# Altium schematic sheet HSS 2026 Blok Diyagram.SchDoc
size A2; SheetNumber: 1; SheetTotal: 7
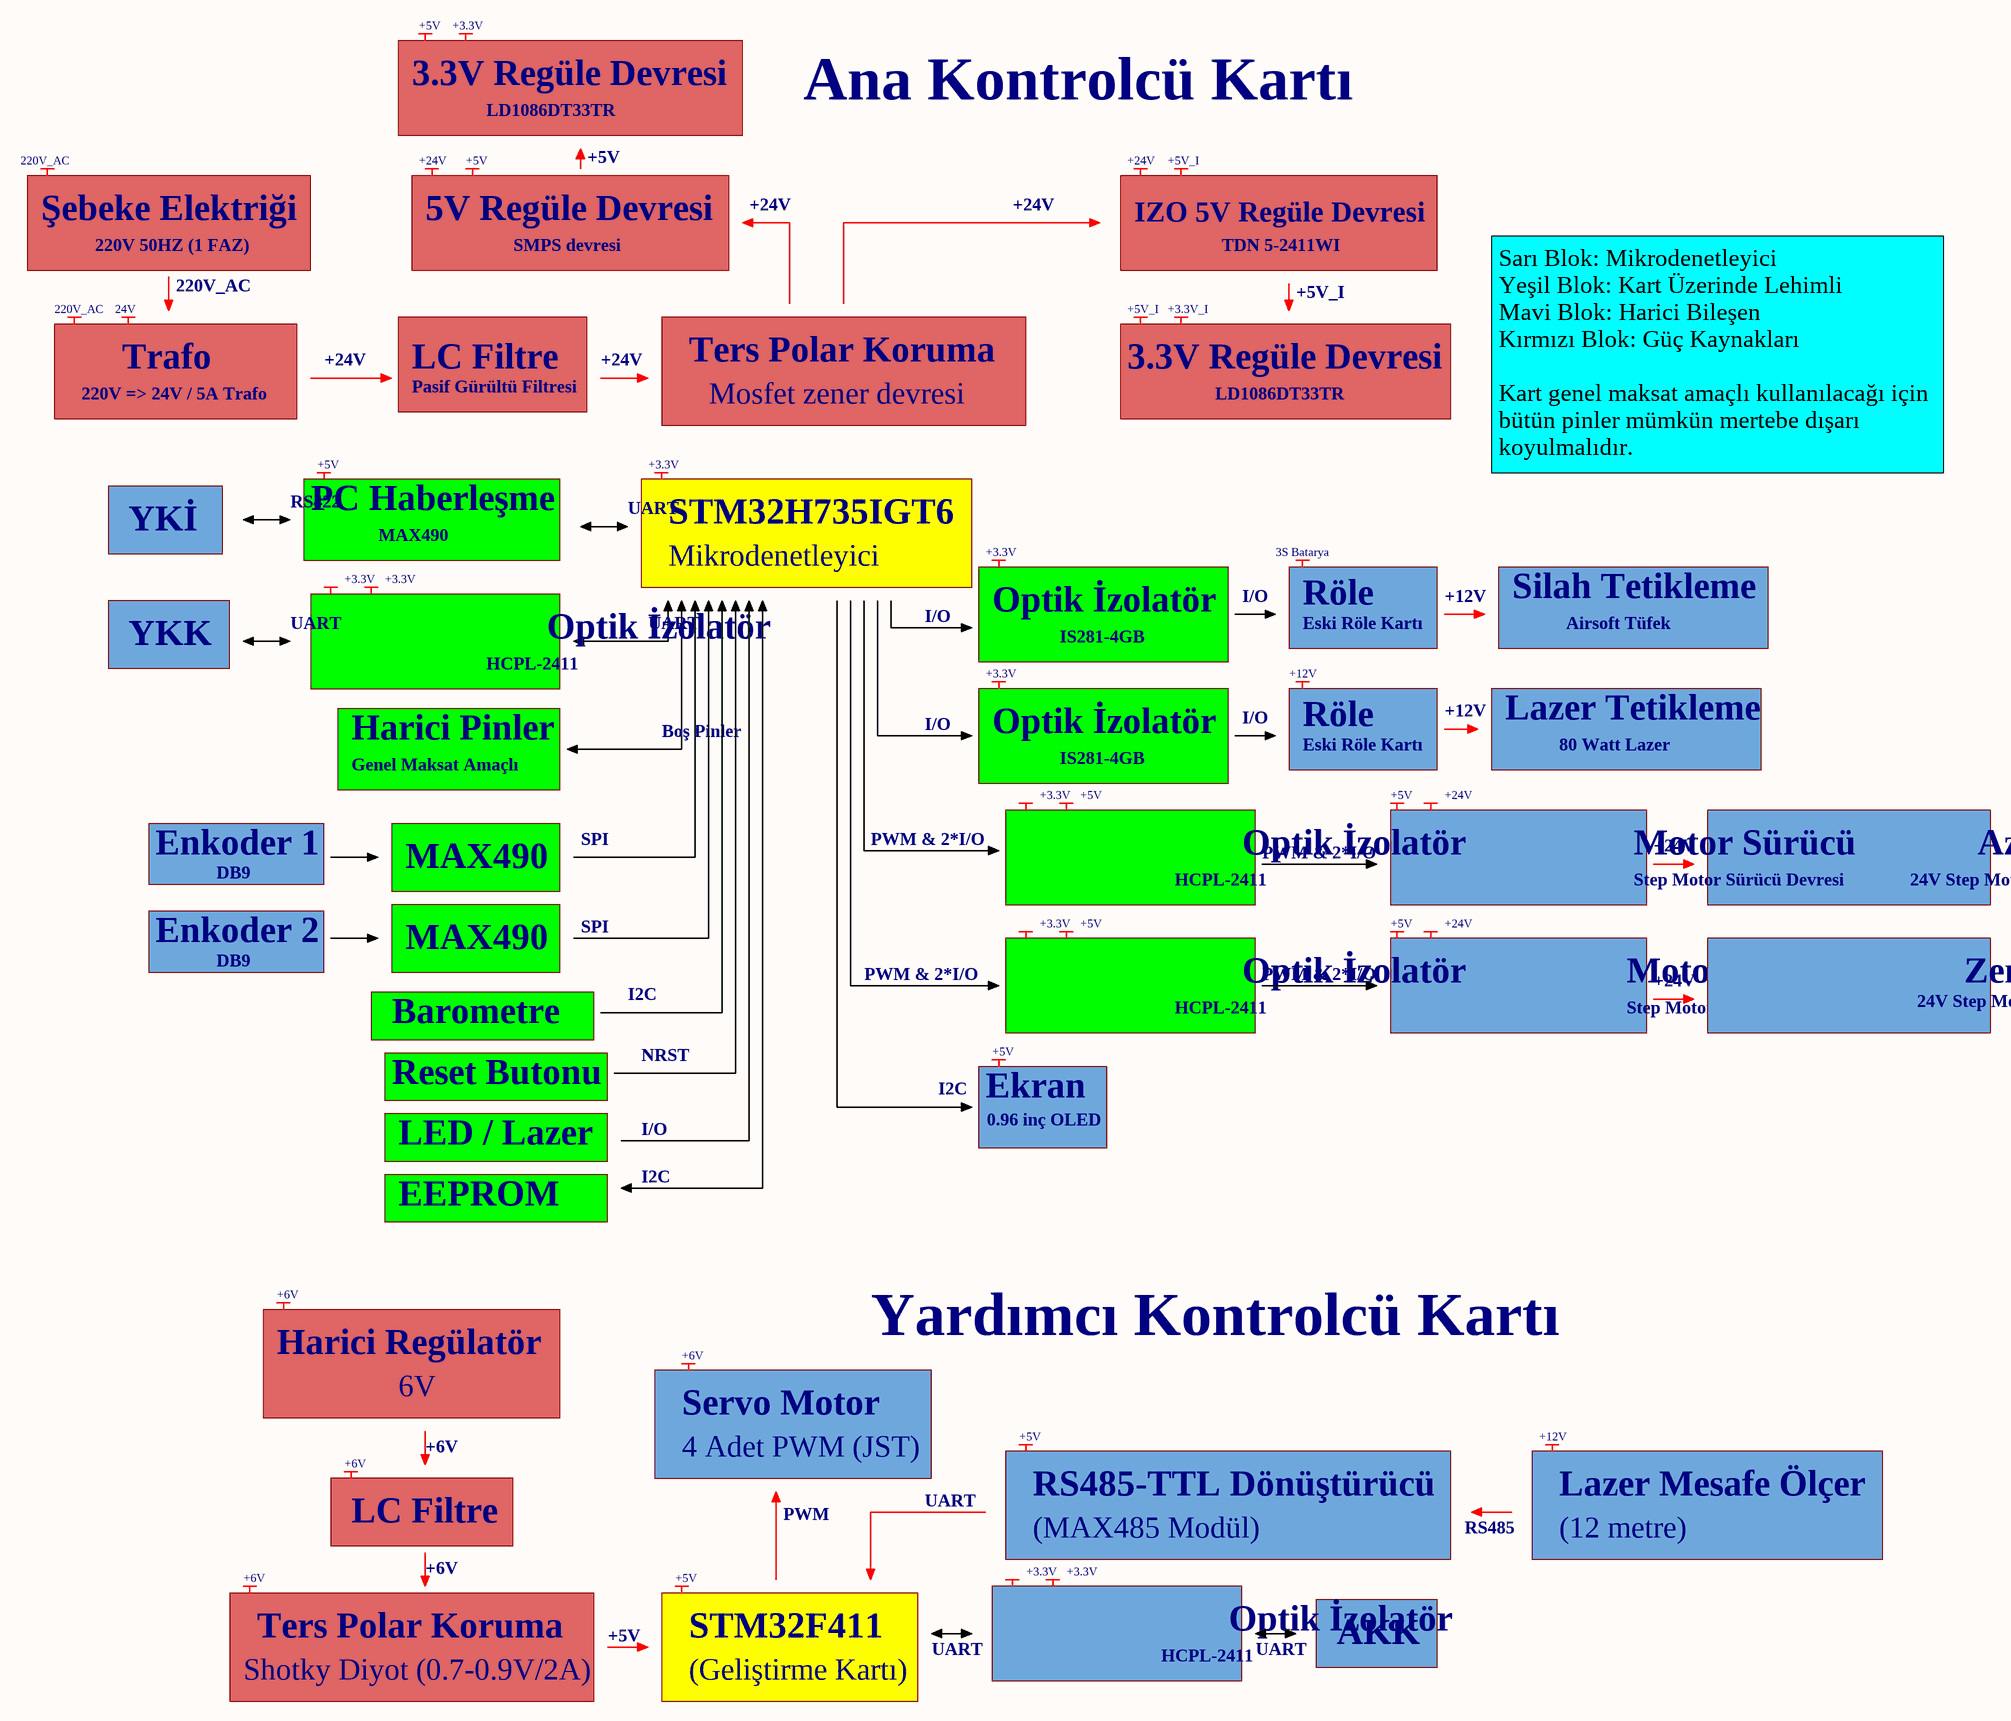
[diagram p0: HSS 2026 Blok Diyagram.SchDoc]

## Notes on the sheet
- +5V
- +3.3V
- 3.3V Regüle Devresi
- 220V_AC
- +24V
- LD1086DT33TR
- Ana Kontrolcü Kartı
- +5V_I
- Şebeke Elektriği
- 5V Regüle Devresi
- IZO 5V Regüle Devresi
- 220V 50HZ (1 FAZ)
- 24V
- SMPS devresi
- +3.3V_I
- TDN 5-2411WI
- Trafo
- LC Filtre
- Ters Polar Koruma
- 220V => 24V / 5A Trafo
- Pasif Gürültü Filtresi
- Mosfet zener devresi
- RS422
- Sarı Blok: Mikrodenetleyici
  Yeşil Blok: Kart Üzerinde Lehimli
  Mavi Blok: Harici Bileşen
  Kırmızı Blok: Güç Kaynakları
  Kart genel maksat amaçlı kullanılacağı için bütün pinler mümkün mertebe dışarı koyulmalıdır.
- YKİ
- PC Haberleşme
- MAX490
- UART
- STM32H735IGT6
- Mikrodenetleyici
- 3S Batarya
- Optik İzolatör
- I/O
- IS281-4GB
- Röle
- Eski Röle Kartı
- +12V
- Silah Tetikleme
- Airsoft Tüfek
- YKK
- HCPL-2411
- Reset Butonu
  2 Kristal
  Uyarı LED'leri
  Boş butonlar
  PWM/+5V/GND
- Harici Pinler
- Genel Maksat Amaçlı
- Boş Pinler
- Lazer Tetikleme
- 80 Watt Lazer
- SPI
- PWM & 2*I/O
- Enkoder 1
- DB9
- Motor Sürücü
- Step Motor Sürücü Devresi
- 24V Step Motor
- Azimuth Motoru
- Enkoder 2
- Zenith Motoru
- Barometre
- I2C
- Reset Butonu
- NRST
- Ekran
- LED / Lazer
- 0.96 inç OLED
- EEPROM
- +6V
- Harici Regülatör
- Yardımcı Kontrolcü Kartı
- 6V
- Servo Motor
- 4 Adet PWM (JST)
- PWM
- RS485-TTL Dönüştürücü
- Lazer Mesafe Ölçer
- (MAX485 Modül)
- RS485
- (12 metre)
- STM32F411
- AKK
- Shotky Diyot (0.7-0.9V/2A)
- Dikkat kartın regülatörü max 5.25V
- (Geliştirme Kartı)